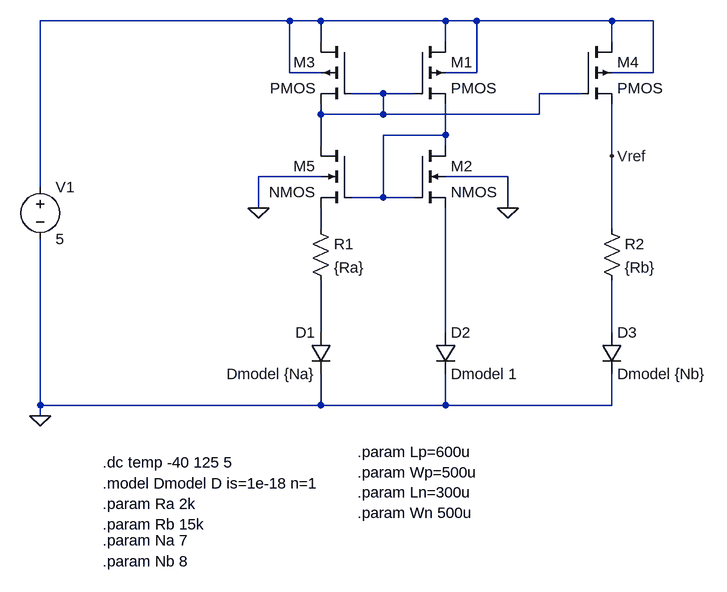
[diagram p0: schematic Bandgap reference.asc]
Bandgap reference.asc, the LTspice schematic file:
Version 4.1
SHEET 1 880 832
WIRE -128 -16 -512 -16
WIRE -80 -16 -128 -16
WIRE 112 -16 -80 -16
WIRE 160 -16 112 -16
WIRE 368 -16 160 -16
WIRE 432 -16 368 -16
WIRE -80 16 -80 -16
WIRE 112 16 112 -16
WIRE 368 16 368 -16
WIRE -128 64 -128 -16
WIRE -80 64 -128 64
WIRE 160 64 160 -16
WIRE 160 64 112 64
WIRE 432 64 432 -16
WIRE 432 64 368 64
WIRE 16 96 -32 96
WIRE 64 96 16 96
WIRE 320 96 256 96
WIRE -80 128 -80 112
WIRE 16 128 16 96
WIRE 16 128 -80 128
WIRE 256 128 256 96
WIRE 256 128 16 128
WIRE 112 160 112 112
WIRE 112 160 16 160
WIRE -80 176 -80 128
WIRE 112 176 112 160
WIRE 368 192 368 112
WIRE -80 224 -176 224
WIRE 208 224 112 224
WIRE -512 240 -512 -16
WIRE 16 256 16 160
WIRE 16 256 -32 256
WIRE 64 256 16 256
WIRE -176 272 -176 224
WIRE 208 272 208 224
WIRE -80 304 -80 272
WIRE 368 304 368 192
WIRE -80 464 -80 384
WIRE 112 464 112 272
WIRE 368 464 368 384
WIRE -512 576 -512 320
WIRE -80 576 -80 528
WIRE -80 576 -512 576
WIRE 112 576 112 528
WIRE 112 576 -80 576
WIRE 368 576 368 528
WIRE 368 576 112 576
WIRE -512 592 -512 576
FLAG -176 272 0
FLAG -512 592 0
FLAG 208 272 0
FLAG 368 192 Vref
SYMBOL pmos4 64 16 R0
SYMATTR InstName M1
SYMATTR Value2 l={Lp} w={Wp}
SYMBOL nmos4 64 176 R0
SYMATTR InstName M2
SYMATTR Value2 l={Ln} w={Wn}
SYMBOL pmos4 -32 16 M0
SYMATTR InstName M3
SYMATTR Value2 l={Lp} w={Wp}
SYMBOL voltage -512 224 R0
WINDOW 123 0 0 Left 0
WINDOW 39 0 0 Left 0
SYMATTR InstName V1
SYMATTR Value 5
SYMBOL pmos4 320 16 R0
SYMATTR InstName M4
SYMATTR Value2 l={Lp} w={Wp}
SYMBOL nmos4 -32 176 M0
SYMATTR InstName M5
SYMATTR Value2 l={Ln} w={Wn}
SYMBOL res -96 288 R0
SYMATTR InstName R1
SYMATTR Value {Ra}
SYMBOL res 352 288 R0
SYMATTR InstName R2
SYMATTR Value {Rb}
SYMBOL diode -64 464 M0
SYMATTR InstName D1
SYMATTR Value Dmodel {Na}
SYMBOL diode 96 464 R0
SYMATTR InstName D2
SYMATTR Value Dmodel 1
SYMBOL diode 352 464 R0
SYMATTR InstName D3
SYMATTR Value Dmodel {Nb}
TEXT -416 664 Left 2 !.dc temp -40 125 5
TEXT -416 696 Left 2 !.model Dmodel D is=1e-18 n=1
TEXT -416 728 Left 2 !.param Ra 2k\n.param Rb 15k
TEXT -416 784 Left 2 !.param Na 7
TEXT -416 816 Left 2 !.param Nb 8
TEXT -24 648 Left 2 !.param Lp=600u\n.param Wp=500u\n.param Ln=300u\n.param Wn 500u

The netlist it stands for:
* Bandgap reference.asc
M1 N001 N002 N003 N001 PMOS l={Lp} w={Wp}
M2 N003 N003 N006 0 NMOS l={Ln} w={Wn}
M3 N001 N002 N002 N001 PMOS l={Lp} w={Wp}
V1 N001 0 5
M4 N001 N002 Vref N001 PMOS l={Lp} w={Wp}
M5 N002 N003 N004 0 NMOS l={Ln} w={Wn}
R1 N004 N005 {Ra}
R2 Vref N007 {Rb}
D1 N005 0 Dmodel {Na}
D2 N006 0 Dmodel 1
D3 N007 0 Dmodel {Nb}
.model D D
.lib standard.dio
.model NMOS NMOS
.model PMOS PMOS
.lib standard.mos
.dc temp -40 125 5
.model Dmodel D is=1e-18 n=1
.param Ra 2k
.param Rb 15k
.param Na 7
.param Nb 8
.param Lp=600u
.param Wp=500u
.param Ln=300u
.param Wn 500u
.backanno
.end